# Altium schematic sheet vishwakarma_Final.SchDoc
size A4
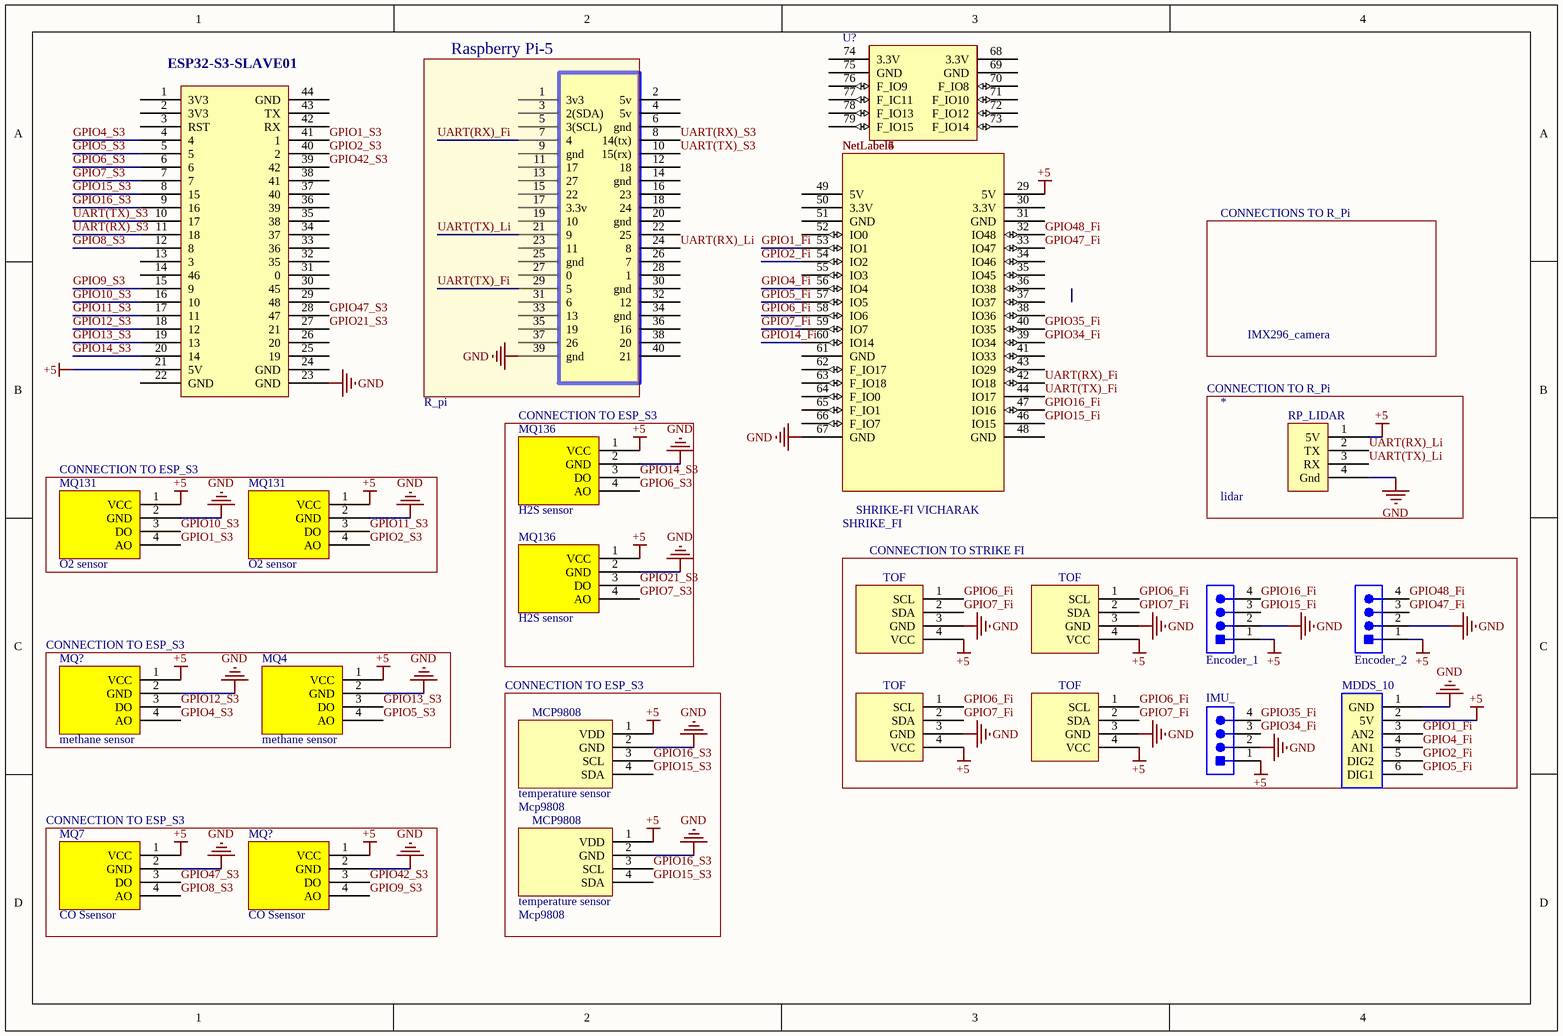
[diagram p0: vishwakarma_Final.SchDoc]

## Parts
(Parts that share a designator on the sheet are numbered #1, #2 ... from top to bottom, then left to right.)
*#1  IMX296_camera
*#2  lidar
*#3  (no value)
*#4  (no value)  (part B of 2)
*#5  TOF  (value not drawn)
*#6  Mcp9808
*#7  Mcp9808
?#1  R_pi
?#2  (no value)
?#3  TOF  (value not drawn)
Encoder_1  B4B-PH-K-S(LF)(SN)  [JST-B4B-PH-K-S_V]  (value not drawn)
Encoder_2  B4B-PH-K-S(LF)(SN)  [JST-B4B-PH-K-S_V]  (value not drawn)
ESP32-S3-SLAVE01  (no value)  [ESP32_S3]
IMU_  (no value)  [JST-B4B-PH-K-S_V]
MQ4  methane sensor
MQ7  CO Ssensor
MQ131#1  O2 sensor
MQ131#2  O2 sensor
MQ136#1  H2S sensor
MQ136#2  H2S sensor
MQ?#1  methane sensor
MQ?#2  CO Ssensor
U?  SHRIKE_FI  [PCBComponent_1]

## Blocks framed on the sheet
CONNECTION TO R_Pi: *#2
CONNECTION TO ESP_S3: MQ136#1 MQ136#2
CONNECTION TO ESP_S3: MQ131#1 MQ131#2
CONNECTION TO ESP_S3: MQ4 MQ?#1
CONNECTION TO ESP_S3: *#6 *#7
CONNECTION TO ESP_S3: MQ7 MQ?#2

## Nets
+5: *#2.1(5V) *#3.4(VCC) *#4.2(5V) *#5.4(VCC) *#6.1(VDD) *#7.1(VDD) ?#2.4(VCC) ?#3.4(VCC) Encoder_1.1 Encoder_2.1 ESP32-S3-SLAVE01.21(5V) IMU_.1 MQ4.1(VCC) MQ7.1(VCC) MQ131#1.1(VCC) MQ131#2.1(VCC) MQ136#1.1(VCC) MQ136#2.1(VCC) MQ?#1.1(VCC) MQ?#2.1(VCC) U?.29(5V)
GND: *#2.4(Gnd) *#3.3(GND) *#4.1(GND) *#5.3(GND) *#6.2(GND) *#7.2(GND) ?#1.39(gnd) ?#2.3(GND) ?#3.3(GND) Encoder_1.2 Encoder_2.2 ESP32-S3-SLAVE01.23(GND) IMU_.2 MQ4.2(GND) MQ7.2(GND) MQ131#1.2(GND) MQ131#2.2(GND) MQ136#1.2(GND) MQ136#2.2(GND) MQ?#1.2(GND) MQ?#2.2(GND) U?.67(GND)
GPIO1_Fi: *#4.3(AN2) U?.53(IO1)
GPIO1_S3: ESP32-S3-SLAVE01.41(1) MQ131#1.4(AO)
GPIO2_Fi: *#4.5(DIG2) U?.54(IO2)
GPIO2_S3: ESP32-S3-SLAVE01.40(2) MQ131#2.4(AO)
GPIO4_Fi: *#4.4(AN1) U?.56(IO4)
GPIO4_S3: ESP32-S3-SLAVE01.4 MQ?#1.4(AO)
GPIO5_Fi: *#4.6(DIG1) U?.57(IO5)
GPIO5_S3: ESP32-S3-SLAVE01.5 MQ4.4(AO)
GPIO6_Fi: *#3.1(SCL) *#5.1(SCL) ?#2.1(SCL) ?#3.1(SCL) U?.58(IO6)
GPIO6_S3: ESP32-S3-SLAVE01.6 MQ136#1.4(AO)
GPIO7_Fi: *#3.2(SDA) *#5.2(SDA) ?#2.2(SDA) ?#3.2(SDA) U?.59(IO7)
GPIO7_S3: ESP32-S3-SLAVE01.7 MQ136#2.4(AO)
GPIO8_S3: ESP32-S3-SLAVE01.12(8) MQ7.4(AO)
GPIO9_S3: ESP32-S3-SLAVE01.15(9) MQ?#2.4(AO)
GPIO10_S3: ESP32-S3-SLAVE01.16(10) MQ131#1.3(DO)
GPIO11_S3: ESP32-S3-SLAVE01.17(11) MQ131#2.3(DO)
GPIO12_S3: ESP32-S3-SLAVE01.18(12) MQ?#1.3(DO)
GPIO13_S3: ESP32-S3-SLAVE01.19(13) MQ4.3(DO)
GPIO14_Fi: U?.60(IO14)
GPIO14_S3: ESP32-S3-SLAVE01.20(14) MQ136#1.3(DO)
GPIO15_Fi: Encoder_1.3 U?.46(IO15)
GPIO15_S3: *#6.4(SDA) *#7.4(SDA) ESP32-S3-SLAVE01.8(15)
GPIO16_Fi: Encoder_1.4 U?.47(IO16)
GPIO16_S3: *#6.3(SCL) *#7.3(SCL) ESP32-S3-SLAVE01.9(16)
GPIO21_S3: ESP32-S3-SLAVE01.27(21) MQ136#2.3(DO)
GPIO34_Fi: IMU_.3 U?.39(IO34)
GPIO35_Fi: IMU_.4 U?.40(IO35)
GPIO42_S3: ESP32-S3-SLAVE01.39(42) MQ?#2.3(DO)
GPIO47_Fi: Encoder_2.3 U?.33(IO47)
GPIO47_S3: ESP32-S3-SLAVE01.28(47) MQ7.3(DO)
GPIO48_Fi: Encoder_2.4 U?.32(IO48)
UART(RX)_Fi: ?#1.7(4) U?.42(IO18)
UART(RX)_Li: *#2.2(TX) ?#1.24(8)
UART(RX)_S3: ?#1.8(14(tx)) ESP32-S3-SLAVE01.11(18)
UART(TX)_Fi: ?#1.29(5) U?.44(IO17)
UART(TX)_Li: *#2.3(RX) ?#1.21(9)
UART(TX)_S3: ?#1.10(15(rx)) ESP32-S3-SLAVE01.10(17)

Not connected (* = marked no-connect by the designer): ?#1 1(3v3) 2(5v) 3(2(SDA)) 4(5v) 5(3(SCL)) 6(gnd) 9(gnd) 11(17) 12(18) 13(27) 14(gnd) 15(22) 16(23) 17(3.3v) 18(24) 19(10) 20(gnd) 22(25) 23(11) 25(gnd) 26(7) 27(0) 28(1) 30(gnd) 31(6) 32(12) 33(13) 34(gnd) 35(19) 36(16) 37(26) 38(20) 40(21); ESP32-S3-SLAVE01 1(3V3) 2(3V3) 3(RST) 13(3) 14(46) 22(GND) 24(GND) 25(19) 26(20) 29(48) 30(45) 31(0) 32(35) 33(36) 34(37) 35(38) 36(39) 37(40) 38(41) 42(RX) 43(TX) 44(GND); U? 30(3.3V) 31(GND) 34(IO46) 35(IO45) 36(IO38) 37(IO37) 38(IO36) 41(IO33) 43(IO29) 48(GND) 49(5V) 50(3.3V) 51(GND) 52(IO0) 55(IO3) 61(GND) 62(F_IO17) 63(F_IO18) 64(F_IO0) 65(F_IO1) 66(F_IO7) 68(3.3V) 69(GND) 70(F_IO8) 71(F_IO10) 72(F_IO12) 73(F_IO14) 74(3.3V) 75(GND) 76(F_IO9) 77(F_IC11) 78(F_IO13) 79(F_IO15)

## Notes on the sheet
- (near *#1) CONNECTIONS TO R_Pi
- CONNECTION TO STRIKE FI
- (near *#4) MDDS_10
- (in symbol lidar) RP_LIDAR
- (in symbol Mcp9808) MCP9808; temperature sensor
- (in symbol R_pi) Raspberry Pi-5
- (in symbol SHRIKE_FI) SHRIKE-FI VICHARAK

## Library data of the parts
*#1 *#4 = Component_1
*#3 ?#2 = TOF
Encoder_1 Encoder_2 IMU_ = CMP-2000-05165-1: Male Header, Pitch 2 mm, 1 x 4 Position, Height 6 mm, Tail Length 3.4 mm, -25 to 85 degC, RoHS, Bulk; Manufacturer: JST; No of Positions: 4; Style/Orientation: StraightHeader/Plug; Pitch: 2mm; Datasheet URL: http://datasheet.octopart.com/B4B-PH-K-S%28LF%29%28SN%29-JST-datasheet-10558886.pdf; Type: ShroudedHeader; Manufacturer URL: http://www.jst.com/home2.html; Termination: Crimp; Datasheet Version: Apr-09
ESP32-S3-SLAVE01 = ESP32_S3: This is a custom made PCB library of ESP32_S3 microcontroller board. This file is offically made by TeamRAW, SFIT. / ESP32-S3 is a dual-core XTensa LX7 MCU, capable of running at 240 MHz. Apart from its 512 KB of internal SRAM, it also comes with integrated 2.4 GHz, 802.11 b/g/n Wi-Fi and Bluetooth 5 (LE) connectivity that provides long-range support. It has 45 programmable GPIOs and supports a rich set of peripherals. ESP32-S3 supports larger, high-speed octal SPI flash, and PSRAM with configurable data and instruction cache.; ComponentLink1Description: https://www.espressif.com/en/products/socs/esp32-s3; ComponentLink1URL: Datasheet
MQ4 MQ7 MQ131#1 MQ131#2 MQ136#1 MQ136#2 MQ?#1 MQ?#2 = mq